# Altium schematic sheet 02.C105. A41-A02. Module Gyroscope.SchDoc: Кабель гироскопа
size 209 x 297 mm; Author: Мурашкин Д.В.; Address1: Address1; Address2: Address2; Address3: Address3; Address4: Address4; DocumentNumber: ИЗДЕЛИЕ-1-2; SheetNumber: 7; Scale: 1:1; Letter1Column: Э
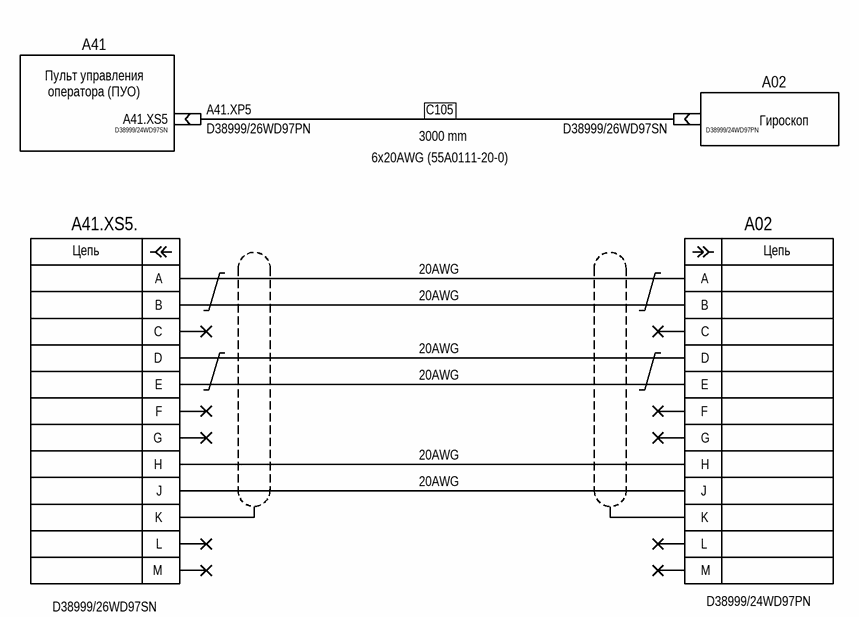
[diagram p0: 02.C105. A41-A02. Module Gyroscope.SchDoc]

## Parts
(Parts that share a designator on the sheet are numbered #1, #2 ... from top to bottom, then left to right.)
A02  D38999/24WD97PN
A41.XP5  D38999/26WD97PN
A41.XS5  D38999/24WD97SN
A41.XS5.  D38999/26WD97SN
A?#1  D38999/26WD97SN
A?#2  D38999/24WD97PN

## Blocks framed on the sheet
A02: A?#2

## Nets
С105: A41.XP5.0 A?#1.0
NetA02_A: A02.A A41.XS5..A
NetA02_B: A02.B A41.XS5..B
NetA02_D: A02.D A41.XS5..D
NetA02_E: A02.E A41.XS5..E
NetA02_H: A02.H A41.XS5..H
NetA02_J: A02.J A41.XS5..J

Not connected (* = marked no-connect by the designer): A02 C* F* G* K L* M*; A41.XS5 0; A41.XS5. C* F* G* K L* M*; A?#2 0

## Notes on the sheet
- A41
- (near A41.XS5) Пульт управления оператора (ПУО)
- (near A?#2) Гироскоп
- 6x20AWG (55A0111-20-0)
- 3000 mm
- 20AWG
- Перв. примен.
- Справ. №
- Подп. и дата
- Инв. № дубл.
- Взам. инв. №
- Инв. № подл.
- Изм.
- Лист
- № докум.
- Подп.
- Дата
- 2.106-A4
- Копировал
- Формат А4
- (in symbol Connector signal P12 MIL) Цепь

## Library data of the parts
A02 A41.XS5. = Connector signal P12 MIL: P12 MIL; Operating temperature: -°C +°C; Mounting type: Surface mount; Dimension: .0mm x .0mm; Height: .0mm
A41.XP5 A?#2 = Connector cable plug: Operating temperature: -°C +°C; Mounting type: Surface mount; Dimension: .0mm x .0mm; Height: .0mm
  A41.XP5: Part name: D38999/26WD97PN
  A?#2: Part name: D38999/24WD97PN
A41.XS5 A?#1 = Connector cable socket: Operating temperature: -°C +°C; Mounting type: Surface mount; Dimension: .0mm x .0mm; Height: .0mm
  A?#1: Part name: D38999/26WD97SN